# EAGLE schematic node (EAGLE 9.6.2)

## Sheet 1 of 5
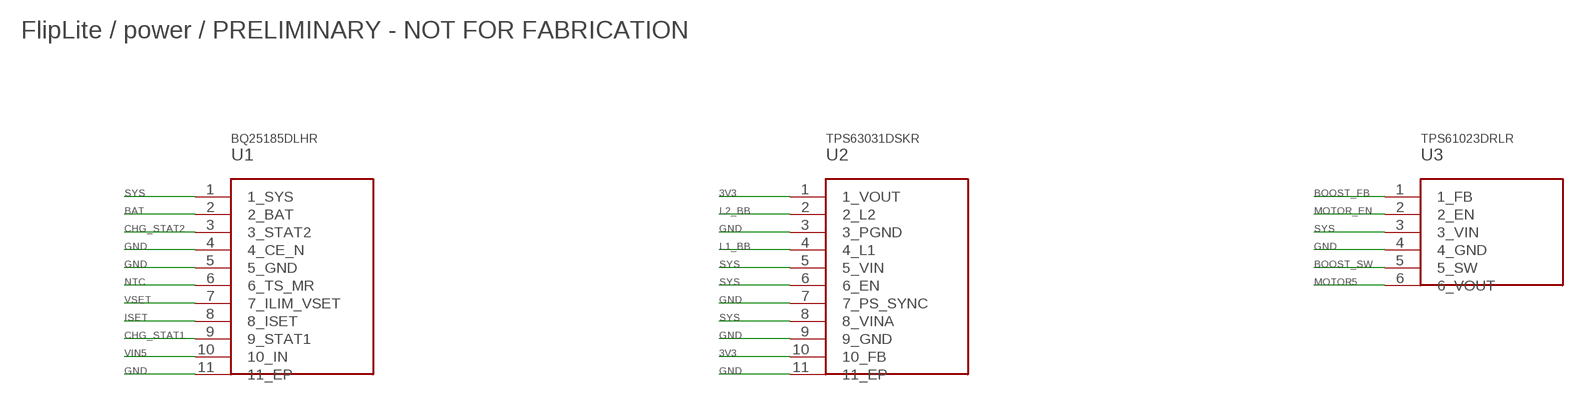
[diagram p0: schematic, sheet 1]

### Parts
U1  BQ25185DLHR  U1_DEV  [U1_PKG]
U2  TPS63031DSKR  U2_DEV  [U2_PKG]
U3  TPS61023DRLR  U3_DEV  [U3_PKG]

### Nets
3V3: U2.1(1_VOUT) U2.10(10_FB) ; also sheet 2,3,4,5
BAT: U1.2(2_BAT) ; also sheet 3,5
BOOST_FB: U3.1(1_FB) ; also sheet 5
BOOST_SW: U3.5(5_SW) ; also sheet 5
CHG_STAT1: U1.9(9_STAT1) ; also sheet 2,5
CHG_STAT2: U1.3(3_STAT2) ; also sheet 2,5
GND: U1.4(4_CE_N) U1.5(5_GND) U1.11(11_EP) U2.3(3_PGND) U2.7(7_PS_SYNC) U2.9(9_GND) U2.11(11_EP) U3.4(4_GND) ; also sheet 2,3,4,5
ISET: U1.8(8_ISET) ; also sheet 5
L1_BB: U2.4(4_L1) ; also sheet 5
L2_BB: U2.2(2_L2) ; also sheet 5
MOTOR5: U3.6(6_VOUT) ; also sheet 3,5
MOTOR_EN: U3.2(2_EN) ; also sheet 2,5
NTC: U1.6(6_TS_MR) ; also sheet 3
SYS: U1.1(1_SYS) U2.5(5_VIN) U2.6(6_EN) U2.8(8_VINA) U3.3(3_VIN) ; also sheet 5
VIN5: U1.10(10_IN) ; also sheet 3,5
VSET: U1.7(7_ILIM_VSET) ; also sheet 5

### Notes on the sheet
- FlipLite / power / PRELIMINARY - NOT FOR FABRICATION

## Sheet 2 of 5
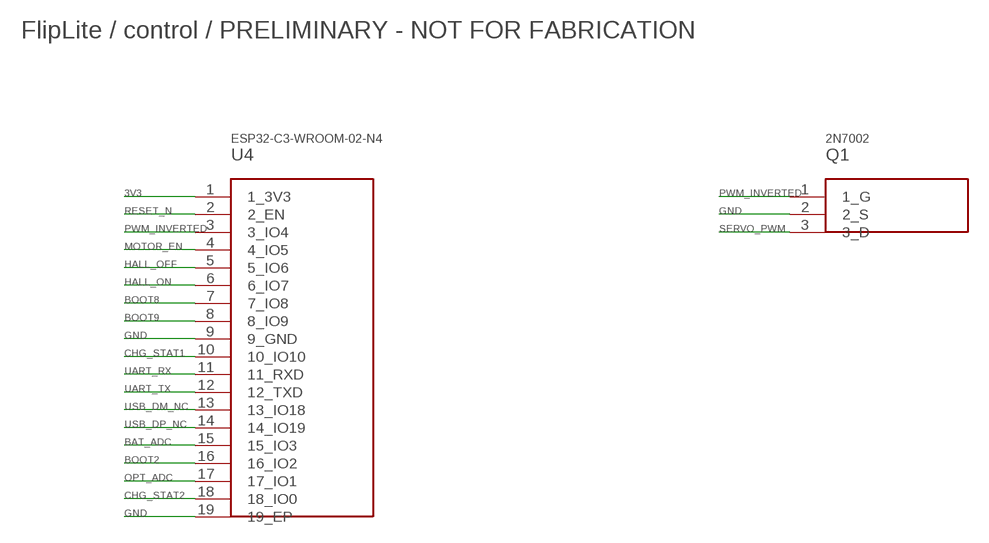
[diagram p1: schematic, sheet 2]

### Parts
Q1  2N7002  Q1_DEV  [Q1_PKG]
U4  ESP32-C3-WROOM-02-N4  U4_DEV  [U4_PKG]

### Nets
3V3: U4.1(1_3V3) ; also sheet 1,3,4,5
BAT_ADC: U4.15(15_IO3) ; also sheet 5
BOOT2: U4.16(16_IO2) ; also sheet 5
BOOT8: U4.7(7_IO8) ; also sheet 5
BOOT9: U4.8(8_IO9) ; also sheet 4,5
CHG_STAT1: U4.10(10_IO10) ; also sheet 1,5
CHG_STAT2: U4.18(18_IO0) ; also sheet 1,5
GND: Q1.2(2_S) U4.9(9_GND) U4.19(19_EP) ; also sheet 1,3,4,5
HALL_OFF: U4.5(5_IO6) ; also sheet 3
HALL_ON: U4.6(6_IO7) ; also sheet 3
MOTOR_EN: U4.4(4_IO5) ; also sheet 1,5
OPT_ADC: U4.17(17_IO1) ; also sheet 5
PWM_INVERTED: Q1.1(1_G) U4.3(3_IO4) ; also sheet 5
RESET_N: U4.2(2_EN) ; also sheet 4,5
SERVO_PWM: Q1.3(3_D) ; also sheet 3,5
UART_RX: U4.11(11_RXD) ; also sheet 4
UART_TX: U4.12(12_TXD) ; also sheet 4
USB_DM_NC: U4.13(13_IO18)
USB_DP_NC: U4.14(14_IO19)

### Notes on the sheet
- FlipLite / control / PRELIMINARY - NOT FOR FABRICATION

## Sheet 3 of 5
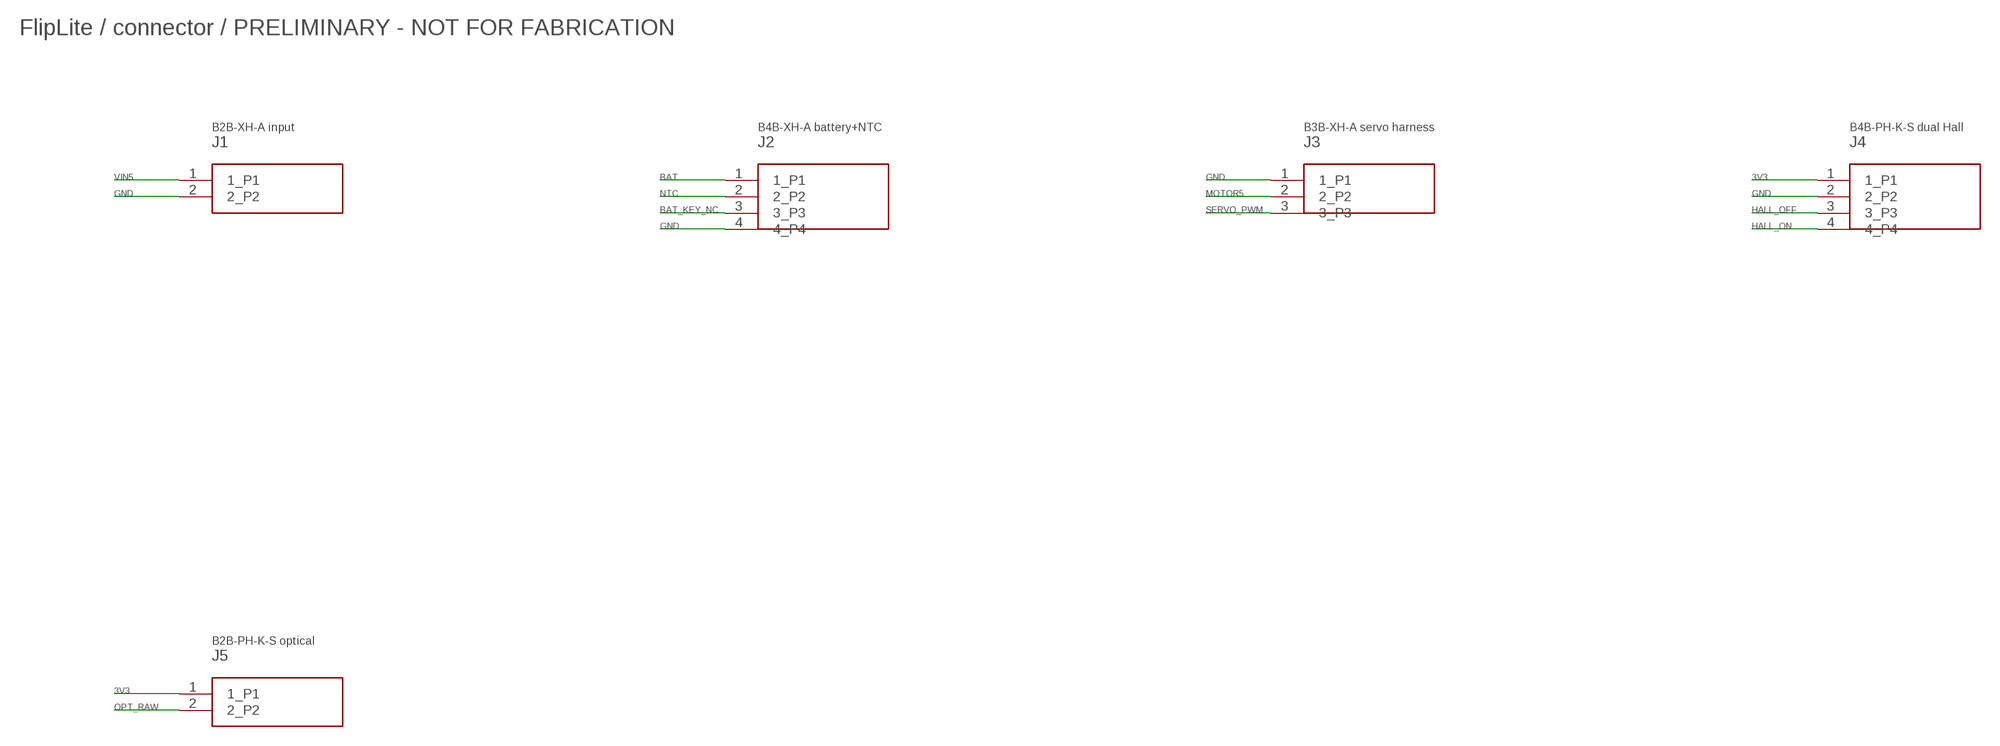
[diagram p2: schematic, sheet 3]

### Parts
J1  B2B-XH-A input  J1_DEV  [J1_PKG]
J2  B4B-XH-A battery+NTC  J2_DEV  [J2_PKG]
J3  B3B-XH-A servo harness  J3_DEV  [J3_PKG]
J4  B4B-PH-K-S dual Hall  J4_DEV  [J4_PKG]
J5  B2B-PH-K-S optical  J5_DEV  [J5_PKG]

### Nets
3V3: J4.1(1_P1) J5.1(1_P1) ; also sheet 1,2,4,5
BAT: J2.1(1_P1) ; also sheet 1,5
BAT_KEY_NC: J2.3(3_P3)
GND: J1.2(2_P2) J2.4(4_P4) J3.1(1_P1) J4.2(2_P2) ; also sheet 1,2,4,5
HALL_OFF: J4.3(3_P3) ; also sheet 2
HALL_ON: J4.4(4_P4) ; also sheet 2
MOTOR5: J3.2(2_P2) ; also sheet 1,5
NTC: J2.2(2_P2) ; also sheet 1
OPT_RAW: J5.2(2_P2) ; also sheet 5
SERVO_PWM: J3.3(3_P3) ; also sheet 2,5
VIN5: J1.1(1_P1) ; also sheet 1,5

### Notes on the sheet
- FlipLite / connector / PRELIMINARY - NOT FOR FABRICATION

## Sheet 4 of 5
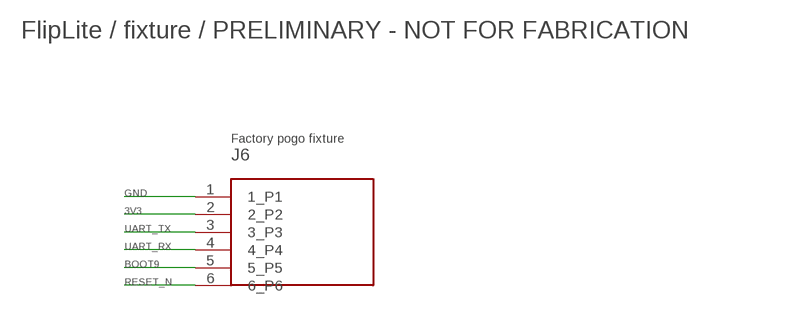
[diagram p3: schematic, sheet 4]

### Parts
J6  Factory pogo fixture  J6_DEV  [J6_PKG]

### Nets
3V3: J6.2(2_P2) ; also sheet 1,2,3,5
BOOT9: J6.5(5_P5) ; also sheet 2,5
GND: J6.1(1_P1) ; also sheet 1,2,3,5
RESET_N: J6.6(6_P6) ; also sheet 2,5
UART_RX: J6.4(4_P4) ; also sheet 2
UART_TX: J6.3(3_P3) ; also sheet 2

### Notes on the sheet
- FlipLite / fixture / PRELIMINARY - NOT FOR FABRICATION

## Sheet 5 of 5
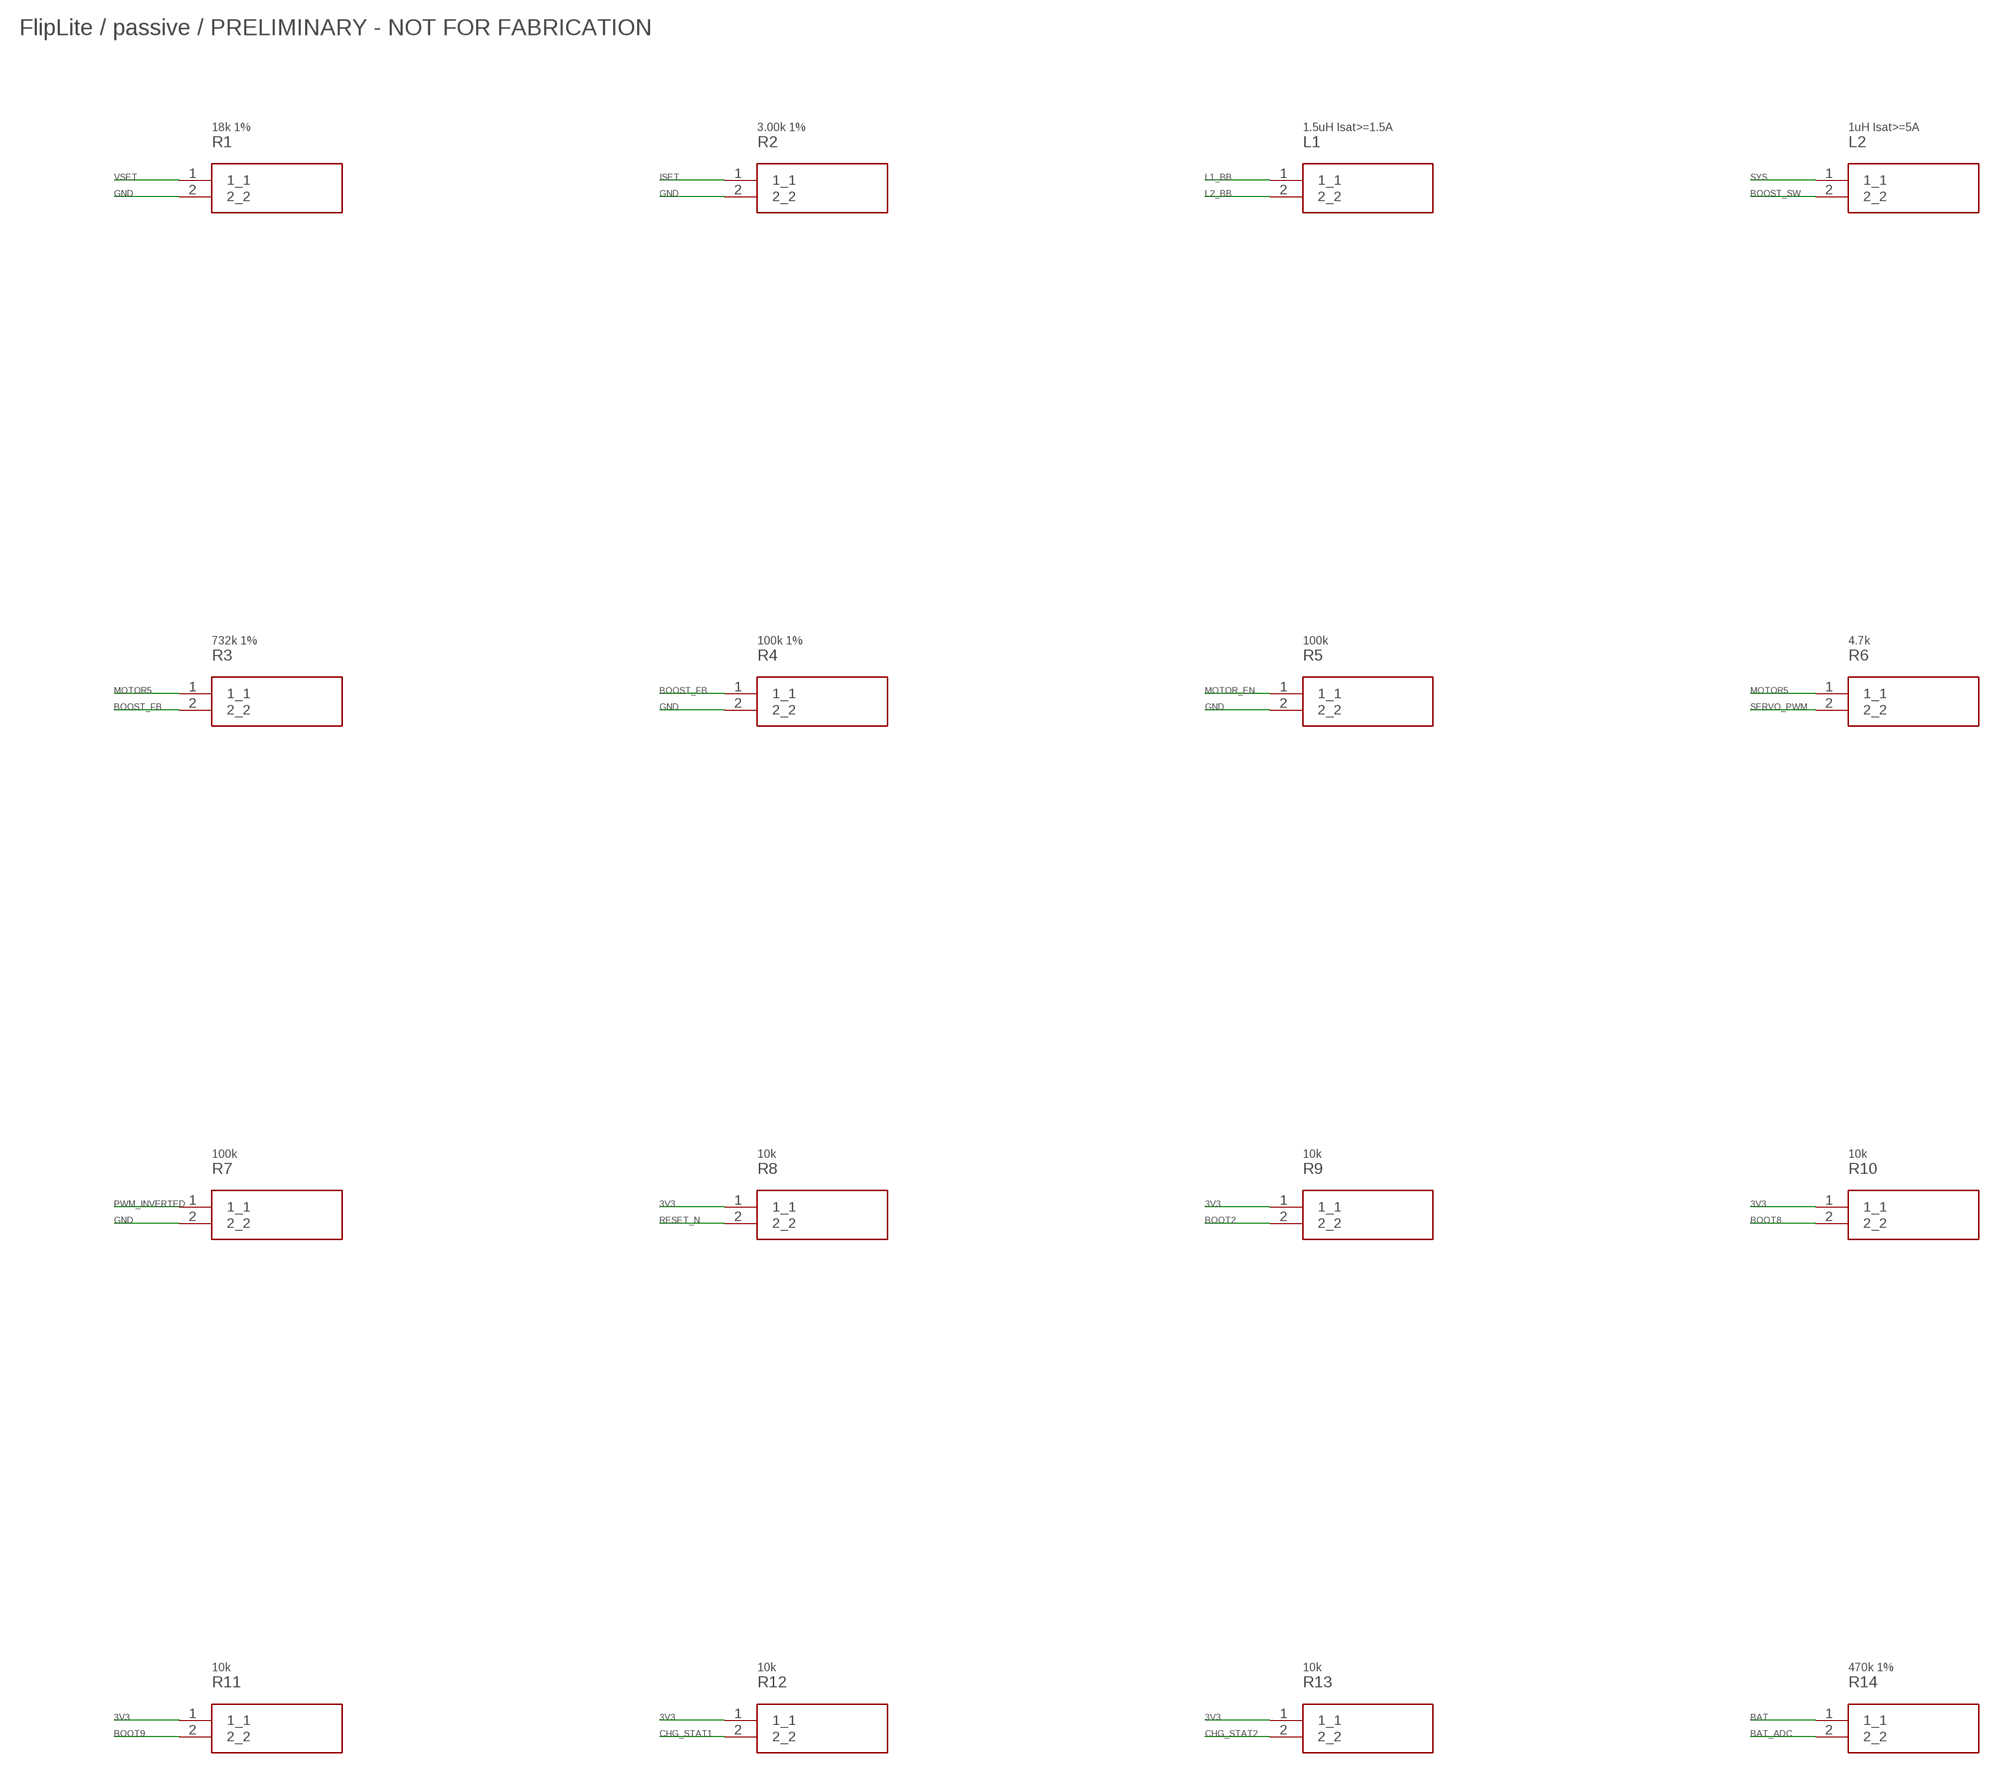
[diagram p4: schematic, sheet 5, part 1 of 2]
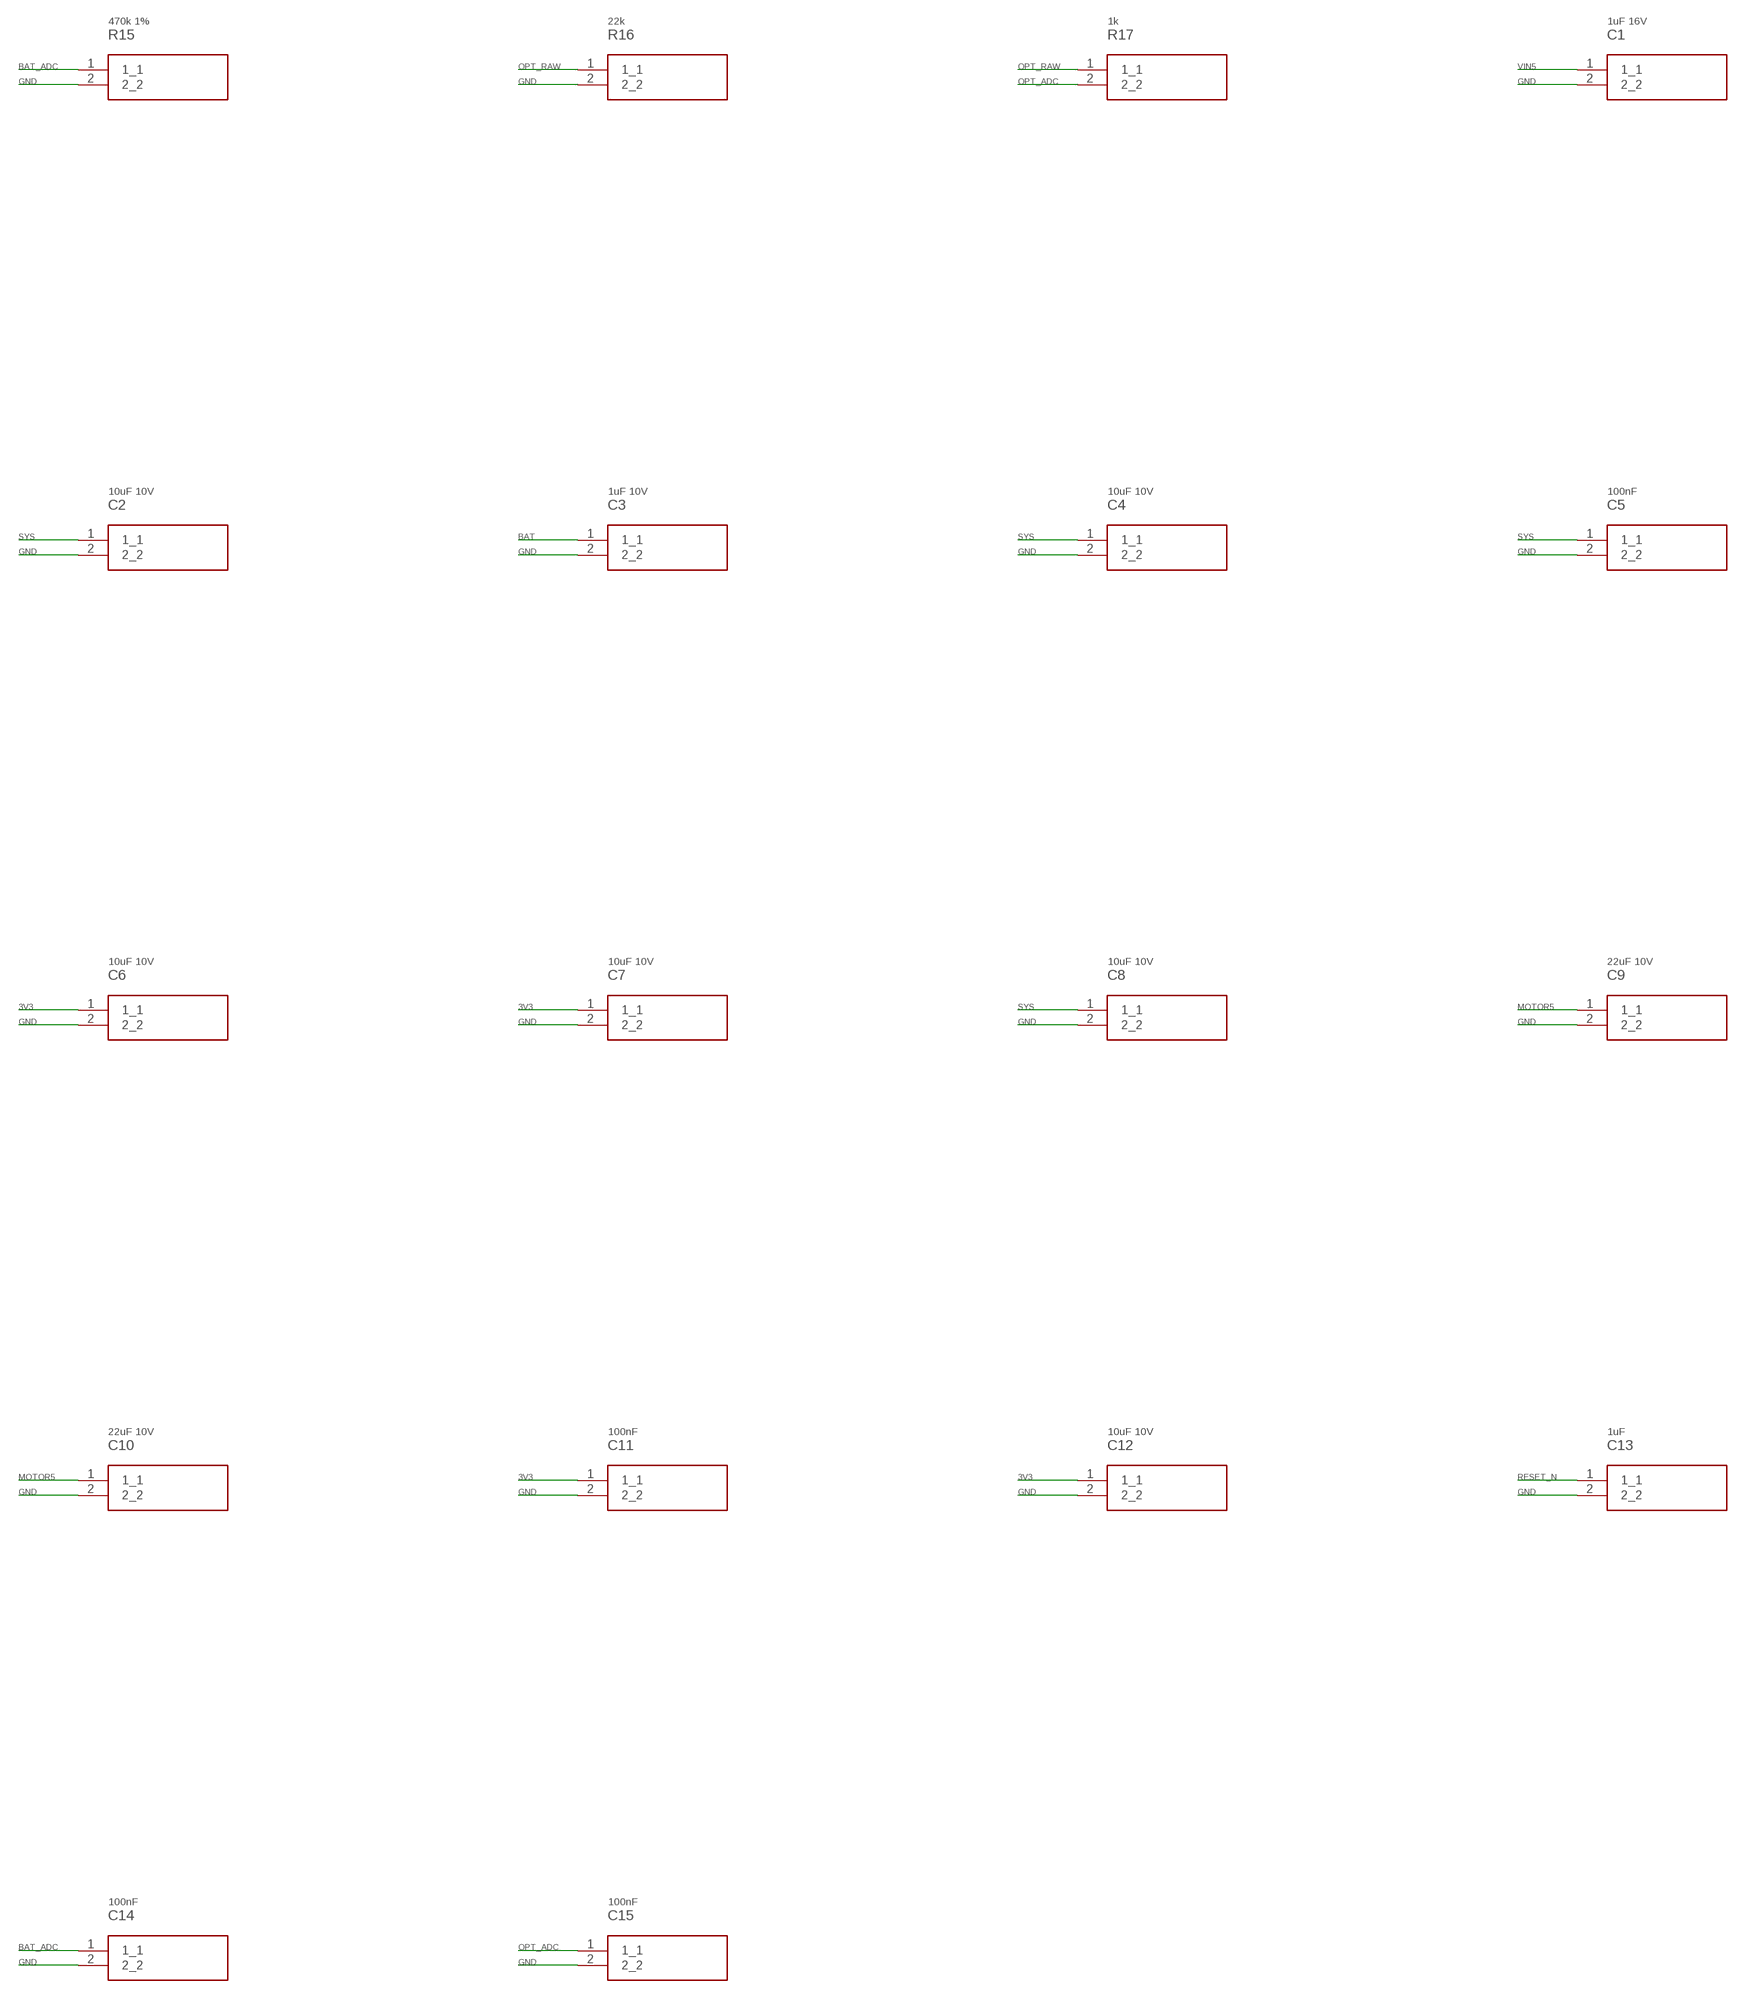
[diagram p5: schematic, sheet 5, part 2 of 2]

### Parts
C1  1uF 16V  C1_DEV  [C1_PKG]
C2  10uF 10V  C2_DEV  [C2_PKG]
C3  1uF 10V  C3_DEV  [C3_PKG]
C4  10uF 10V  C4_DEV  [C4_PKG]
C5  100nF  C5_DEV  [C5_PKG]
C6  10uF 10V  C6_DEV  [C6_PKG]
C7  10uF 10V  C7_DEV  [C7_PKG]
C8  10uF 10V  C8_DEV  [C8_PKG]
C9  22uF 10V  C9_DEV  [C9_PKG]
C10  22uF 10V  C10_DEV  [C10_PKG]
C11  100nF  C11_DEV  [C11_PKG]
C12  10uF 10V  C12_DEV  [C12_PKG]
C13  1uF  C13_DEV  [C13_PKG]
C14  100nF  C14_DEV  [C14_PKG]
C15  100nF  C15_DEV  [C15_PKG]
L1  1.5uH Isat>=1.5A  L1_DEV  [L1_PKG]
L2  1uH Isat>=5A  L2_DEV  [L2_PKG]
R1  18k 1%  R1_DEV  [R1_PKG]
R2  3.00k 1%  R2_DEV  [R2_PKG]
R3  732k 1%  R3_DEV  [R3_PKG]
R4  100k 1%  R4_DEV  [R4_PKG]
R5  100k  R5_DEV  [R5_PKG]
R6  4.7k  R6_DEV  [R6_PKG]
R7  100k  R7_DEV  [R7_PKG]
R8  10k  R8_DEV  [R8_PKG]
R9  10k  R9_DEV  [R9_PKG]
R10  10k  R10_DEV  [R10_PKG]
R11  10k  R11_DEV  [R11_PKG]
R12  10k  R12_DEV  [R12_PKG]
R13  10k  R13_DEV  [R13_PKG]
R14  470k 1%  R14_DEV  [R14_PKG]
R15  470k 1%  R15_DEV  [R15_PKG]
R16  22k  R16_DEV  [R16_PKG]
R17  1k  R17_DEV  [R17_PKG]

### Nets
3V3: C6.1(1_1) C7.1(1_1) C11.1(1_1) C12.1(1_1) R8.1(1_1) R9.1(1_1) R10.1(1_1) R11.1(1_1) R12.1(1_1) R13.1(1_1) ; also sheet 1,2,3,4
BAT: C3.1(1_1) R14.1(1_1) ; also sheet 1,3
BAT_ADC: C14.1(1_1) R14.2(2_2) R15.1(1_1) ; also sheet 2
BOOST_FB: R3.2(2_2) R4.1(1_1) ; also sheet 1
BOOST_SW: L2.2(2_2) ; also sheet 1
BOOT2: R9.2(2_2) ; also sheet 2
BOOT8: R10.2(2_2) ; also sheet 2
BOOT9: R11.2(2_2) ; also sheet 2,4
CHG_STAT1: R12.2(2_2) ; also sheet 1,2
CHG_STAT2: R13.2(2_2) ; also sheet 1,2
GND: C1.2(2_2) C2.2(2_2) C3.2(2_2) C4.2(2_2) C5.2(2_2) C6.2(2_2) C7.2(2_2) C8.2(2_2) C9.2(2_2) C10.2(2_2) C11.2(2_2) C12.2(2_2) C13.2(2_2) C14.2(2_2) C15.2(2_2) R1.2(2_2) R2.2(2_2) R4.2(2_2) R5.2(2_2) R7.2(2_2) R15.2(2_2) R16.2(2_2) ; also sheet 1,2,3,4
ISET: R2.1(1_1) ; also sheet 1
L1_BB: L1.1(1_1) ; also sheet 1
L2_BB: L1.2(2_2) ; also sheet 1
MOTOR5: C9.1(1_1) C10.1(1_1) R3.1(1_1) R6.1(1_1) ; also sheet 1,3
MOTOR_EN: R5.1(1_1) ; also sheet 1,2
OPT_ADC: C15.1(1_1) R17.2(2_2) ; also sheet 2
OPT_RAW: R16.1(1_1) R17.1(1_1) ; also sheet 3
PWM_INVERTED: R7.1(1_1) ; also sheet 2
RESET_N: C13.1(1_1) R8.2(2_2) ; also sheet 2,4
SERVO_PWM: R6.2(2_2) ; also sheet 2,3
SYS: C2.1(1_1) C4.1(1_1) C5.1(1_1) C8.1(1_1) L2.1(1_1) ; also sheet 1
VIN5: C1.1(1_1) ; also sheet 1,3
VSET: R1.1(1_1) ; also sheet 1

### Notes on the sheet
- FlipLite / passive / PRELIMINARY - NOT FOR FABRICATION

## Library data of the parts
C1 = FlipLite_Prototype:C1_DEV
C2 = FlipLite_Prototype:C2_DEV
C3 = FlipLite_Prototype:C3_DEV
C4 = FlipLite_Prototype:C4_DEV
C5 = FlipLite_Prototype:C5_DEV
C6 = FlipLite_Prototype:C6_DEV
C7 = FlipLite_Prototype:C7_DEV
C8 = FlipLite_Prototype:C8_DEV
C9 = FlipLite_Prototype:C9_DEV
C10 = FlipLite_Prototype:C10_DEV
C11 = FlipLite_Prototype:C11_DEV
C12 = FlipLite_Prototype:C12_DEV
C13 = FlipLite_Prototype:C13_DEV
C14 = FlipLite_Prototype:C14_DEV
C15 = FlipLite_Prototype:C15_DEV
J1 = FlipLite_Prototype:J1_DEV
J2 = FlipLite_Prototype:J2_DEV
J3 = FlipLite_Prototype:J3_DEV
J4 = FlipLite_Prototype:J4_DEV
J5 = FlipLite_Prototype:J5_DEV
J6 = FlipLite_Prototype:J6_DEV
L1 = FlipLite_Prototype:L1_DEV
L2 = FlipLite_Prototype:L2_DEV
Q1 = FlipLite_Prototype:Q1_DEV
R1 = FlipLite_Prototype:R1_DEV
R2 = FlipLite_Prototype:R2_DEV
R3 = FlipLite_Prototype:R3_DEV
R4 = FlipLite_Prototype:R4_DEV
R5 = FlipLite_Prototype:R5_DEV
R6 = FlipLite_Prototype:R6_DEV
R7 = FlipLite_Prototype:R7_DEV
R8 = FlipLite_Prototype:R8_DEV
R9 = FlipLite_Prototype:R9_DEV
R10 = FlipLite_Prototype:R10_DEV
R11 = FlipLite_Prototype:R11_DEV
R12 = FlipLite_Prototype:R12_DEV
R13 = FlipLite_Prototype:R13_DEV
R14 = FlipLite_Prototype:R14_DEV
R15 = FlipLite_Prototype:R15_DEV
R16 = FlipLite_Prototype:R16_DEV
R17 = FlipLite_Prototype:R17_DEV
U1 = FlipLite_Prototype:U1_DEV
U2 = FlipLite_Prototype:U2_DEV
U3 = FlipLite_Prototype:U3_DEV
U4 = FlipLite_Prototype:U4_DEV

## Net classes
0 default: width 0.25 mm, drill 0.3 mm